# Altium schematic sheet 原理图.SCHDOC
size A3
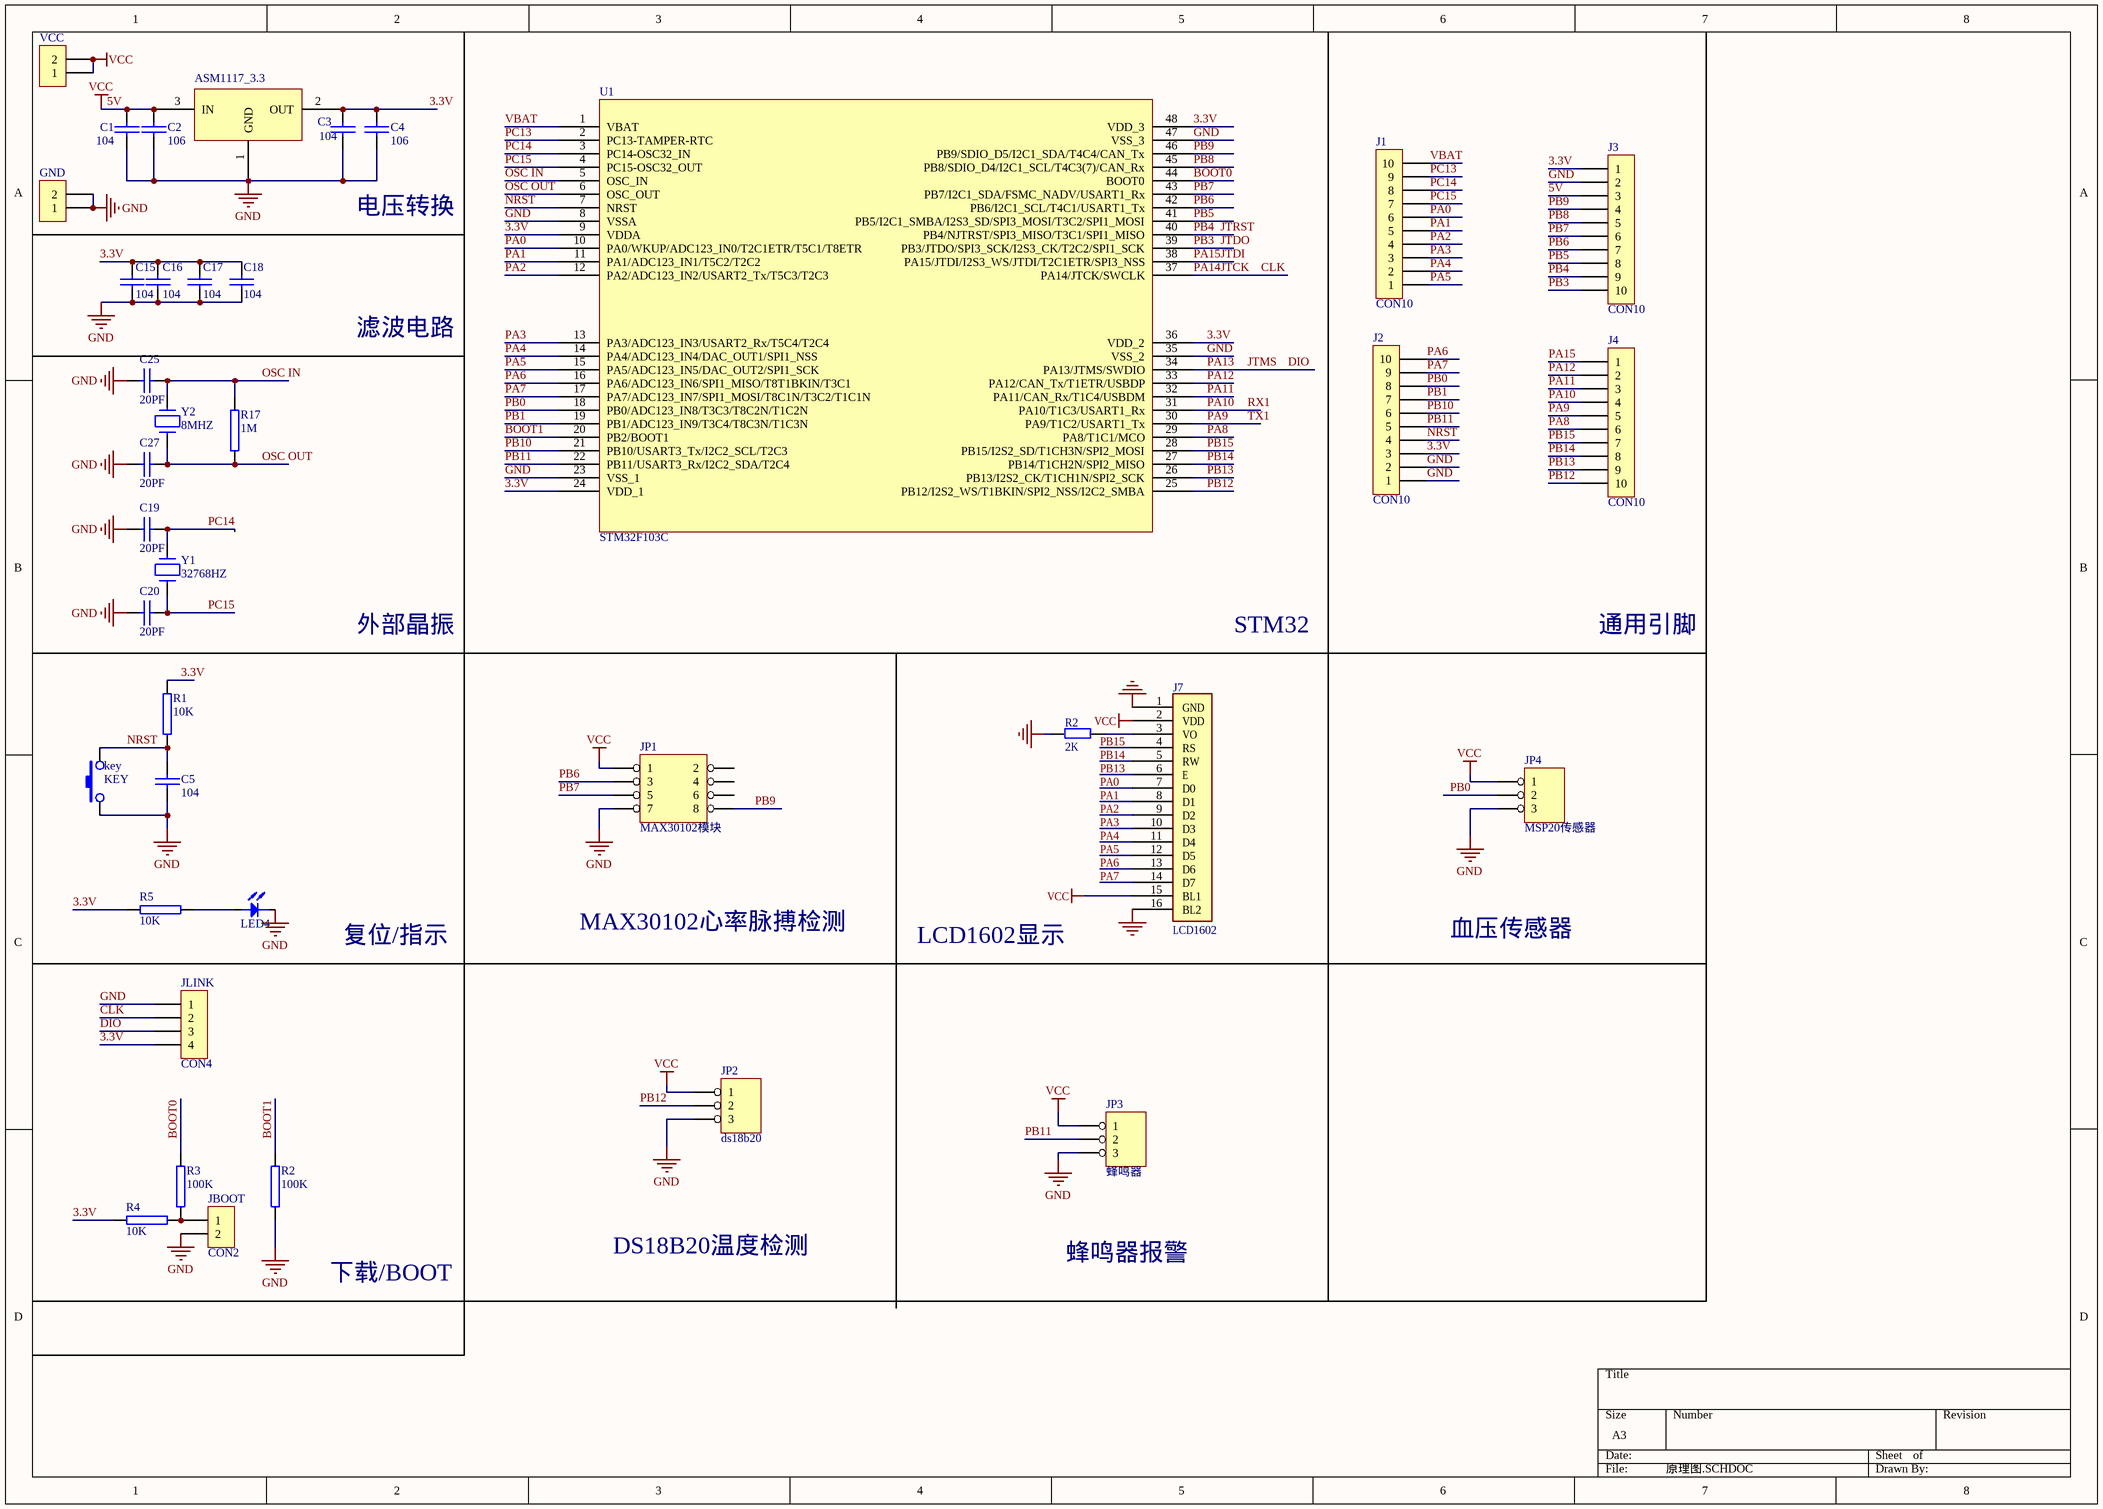
[diagram p0: 原理图.SCHDOC]

## Parts
ASM1117_3.3  ASM1117  [SOT223]  (value not drawn)
C1  104  [0805]
C2  106  [0805]
C3  104  [0805]
C4  106  [0805]
C5  104  [0805]
C15  104  [0805]
C16  104  [0805]
C17  104  [0805]
C18  104  [0805]
C19  20PF  [0805]
C20  20PF  [0805]
C25  20PF  [0805]
C27  20PF  [0805]
GND  CON2  [SIP2]  (value not drawn)
J1  CON10  [sip10]
J2  CON10  [sip10]
J3  CON10  [sip10]
J4  CON10  [sip10]
JBOOT  CON2  [SIP2]
JLINK  CON4  [SIP4]
JP1  MAX30102模块
JP2  ds18b20
JP3  蜂鸣器
JP4  MSP20传感器
key  KEY  [AN2P]
LED4  LED  [0805]  (value not drawn)
R1  10K  [0805]
R2  100K  [0805]
R3  100K  [0805]
R4  10K  [0805]
R5  10K  [0805]
R17  1M  [0805]
U1  STM32F103C  [LQFP-48_M]
VCC  CON2  [SIP2]  (value not drawn)
Y1  32768HZ  [XTAL_1]
Y2  8MHZ  [XTAL]

## Nets
5V: ASM1117_3.3.3(IN) C1.2 C2.2 J3.3 JP1.1 JP2.1 JP3.1 JP4.1 VCC.1 VCC.2  [also labelled VCC]
GND: ASM1117_3.3.1(GND) C1.1 C2.1 C3.1 C4.1 C5.1 C15.1 C16.1 C17.1 C18.1 C19.1 C20.1 C25.1 C27.1 GND.1 GND.2 J2.1 J2.2 J3.2 JBOOT.2 JLINK.1 JP1.7 JP2.3 JP3.3 JP4.3 key.1 LED4.K R2.1 U1.8(VSSA) U1.23(VSS_1) U1.35(VSS_2) U1.47(VSS_3)
3.3V: ASM1117_3.3.2(OUT) C3.2 C4.2 C15.2 C16.2 C17.2 C18.2 J2.3 J3.1 JLINK.4 R1.2 R4.2 R5.2 U1.9(VDDA) U1.24(VDD_1) U1.36(VDD_2) U1.48(VDD_3)
BOOT0: R3.2 U1.44(BOOT0)
BOOT1: R2.2 U1.20(PB2/BOOT1)
CLK: JLINK.2 U1.37(PA14/JTCK/SWCLK)  [also labelled JTCK, PA14]
DIO: JLINK.3 U1.34(PA13/JTMS/SWDIO)  [also labelled JTMS, PA13]
JTDI: J4.1 U1.38(PA15/JTDI/I2S3_WS/JTDI/T2C1ETR/SPI3_NSS)  [also labelled PA15]
JTDO: J3.10 U1.39(PB3/JTDO/SPI3_SCK/I2S3_CK/T2C2/SPI1_SCK)  [also labelled PB3]
JTRST: J3.9 U1.40(PB4/NJTRST/SPI3_MISO/T3C1/SPI1_MISO)  [also labelled PB4]
NRST: C5.2 J2.4 key.2 R1.1 U1.7(NRST)
OSC IN: C25.2 R17.2 U1.5(OSC_IN) Y2.2
OSC OUT: C27.2 R17.1 U1.6(OSC_OUT) Y2.1
PA0: J1.6 U1.10(PA0/WKUP/ADC123_IN0/T2C1ETR/T5C1/T8ETR)
PA1: J1.5 U1.11(PA1/ADC123_IN1/T5C2/T2C2)
PA2: J1.4 U1.12(PA2/ADC123_IN2/USART2_Tx/T5C3/T2C3)
PA3: J1.3 U1.13(PA3/ADC123_IN3/USART2_Rx/T5C4/T2C4)
PA4: J1.2 U1.14(PA4/ADC123_IN4/DAC_OUT1/SPI1_NSS)
PA5: J1.1 U1.15(PA5/ADC123_IN5/DAC_OUT2/SPI1_SCK)
PA6: J2.10 U1.16(PA6/ADC123_IN6/SPI1_MISO/T8T1BKIN/T3C1)
PA7: J2.9 U1.17(PA7/ADC123_IN7/SPI1_MOSI/T8C1N/T3C2/T1C1N)
PA8: J4.6 U1.29(PA8/T1C1/MCO)
PA9: J4.5 U1.30(PA9/T1C2/USART1_Tx)  [also labelled TX1]
PA10: J4.4 U1.31(PA10/T1C3/USART1_Rx)  [also labelled RX1]
PA11: J4.3 U1.32(PA11/CAN_Rx/T1C4/USBDM)
PA12: J4.2 U1.33(PA12/CAN_Tx/T1ETR/USBDP)
PB0: J2.8 JP4.2 U1.18(PB0/ADC123_IN8/T3C3/T8C2N/T1C2N)
PB1: J2.7 U1.19(PB1/ADC123_IN9/T3C4/T8C3N/T1C3N)
PB5: J3.8 U1.41(PB5/I2C1_SMBA/I2S3_SD/SPI3_MOSI/T3C2/SPI1_MOSI)
PB6: J3.7 JP1.3 U1.42(PB6/I2C1_SCL/T4C1/USART1_Tx)
PB7: J3.6 JP1.5 U1.43(PB7/I2C1_SDA/FSMC_NADV/USART1_Rx)
PB8: J3.5 U1.45(PB8/SDIO_D4/I2C1_SCL/T4C3(7)/CAN_Rx)
PB9: J3.4 JP1.8 U1.46(PB9/SDIO_D5/I2C1_SDA/T4C4/CAN_Tx)
PB10: J2.6 U1.21(PB10/USART3_Tx/I2C2_SCL/T2C3)
PB11: J2.5 JP3.2 U1.22(PB11/USART3_Rx/I2C2_SDA/T2C4)
PB12: J4.10 JP2.2 U1.25(PB12/I2S2_WS/T1BKIN/SPI2_NSS/I2C2_SMBA)
PB13: J4.9 U1.26(PB13/I2S2_CK/T1CH1N/SPI2_SCK)
PB14: J4.8 U1.27(PB14/T1CH2N/SPI2_MISO)
PB15: J4.7 U1.28(PB15/I2S2_SD/T1CH3N/SPI2_MOSI)
PC13: J1.9 U1.2(PC13-TAMPER-RTC)
PC14: C19.2 J1.8 U1.3(PC14-OSC32_IN) Y1.2
PC15: C20.2 J1.7 U1.4(PC15-OSC32_OUT) Y1.1
VBAT: J1.10 U1.1(VBAT)
NetJBOOT_1: JBOOT.1 R3.1 R4.1
NetLED4_A: LED4.A R5.1

Not connected (* = marked no-connect by the designer): JP1 2 4 6

## Notes on the sheet
- 电压转换
- 滤波电路
- 外部晶振
- STM32
- 通用引脚
- 复位/指示
- MAX30102心率脉搏检测
- LCD1602显示
- 血压传感器
- DS18B20温度检测
- 蜂鸣器报警
- 下载/BOOT

## Library data of the parts
C1-C5 C15-C20 C25 C27 = CAP
JP1 = HEADER 4X2
JP2-JP4 = HEADER 3
LED4 = LED: pin to pad: A>1 K>2
R1-R5 R17 = RES
U1 = STM32F103C: STM32单片机48引脚
Y1 Y2 = CRYSTAL